# Altium project 5V_STEPDOWN.PrjPcb
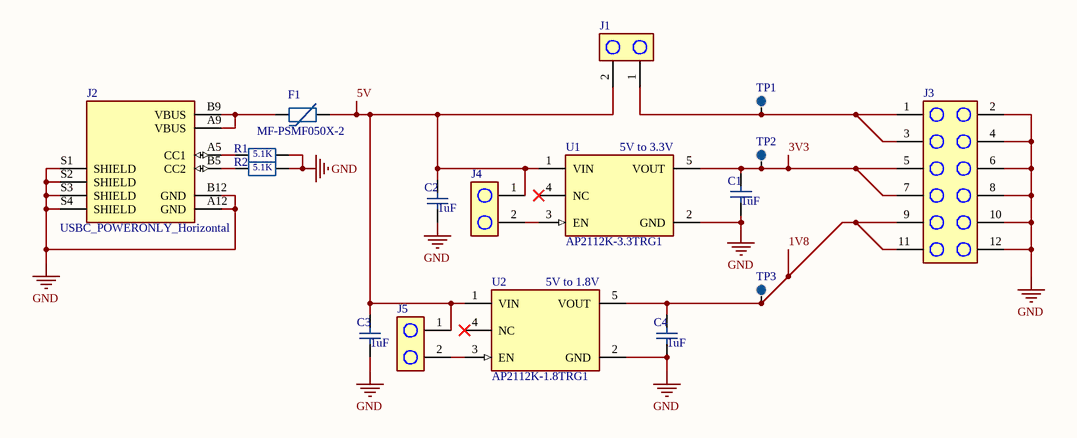
[diagram p0: Sheet1.SchDoc]
1 sheet, 17 parts. Net scope: global (net labels, ports and power ports of the same name join across sheets).
Board file: PCB1.PcbDoc

## Sheet Sheet1.SchDoc
size A2; SheetNumber: 1; SheetTotal: 1

### Parts
C1  1uF  [CAP_0603]
C2  1uF  [CAP_0603]
C3  1uF  [CAP_0603]
C4  1uF  [CAP_0603]
F1  MF-PSMF050X-2  [MF-PSMF050X]
J1  TSW-102-07-G-S  [TSW-102-07-G-S]  (value not drawn)
J2  USBC_POWERONLY_Horizontal  [USBC_POWERDELIVERY_HORIZONTAL]
J3  10129381-912002BLF  [10129381-912002BLF]  (value not drawn)
J4  TSW-102-07-G-S  [TSW-102-07-G-S]  (value not drawn)
J5  TSW-102-07-G-S  [TSW-102-07-G-S]  (value not drawn)
R1  5.1K  [RES_0603]
R2  5.1K  [RES_0603]
TP1  TestPoint_0.4mm  [TestPoint_0.4mm_SMD]  (value not drawn)  (no BOM)
TP2  TestPoint_0.4mm  [TestPoint_0.4mm_SMD]  (value not drawn)  (no BOM)
TP3  TestPoint_0.4mm  [TestPoint_0.4mm_SMD]  (value not drawn)  (no BOM)
U1  AP2112K-3.3TRG1  [AP2112K-3.3TRG1]
U2  AP2112K-1.8TRG1  [AP2112K-1.8TRG1]

### Nets
GND: C1.1 C2.1 C3.1 C4.1 J2.A12(GND) J2.B12(GND) J2.S1(SHIELD) J2.S2(SHIELD) J2.S3(SHIELD) J2.S4(SHIELD) J3.2 J3.4 J3.6 J3.8 J3.10 J3.12 R1.2 R2.2 U1.2(GND) U2.2(GND)
1V8: C4.2 J3.9 J3.11 TP3.1 U2.5(VOUT)
3V3: C1.2 J3.5 J3.7 TP2.1 U1.5(VOUT)
5V: C2.2 C3.2 F1.2 J1.2 J4.1 J5.1 U1.1(VIN) U2.1(VIN)
NetF1_1: F1.1 J2.A9(VBUS) J2.B9(VBUS)
NetJ1_1: J1.1 J3.1 J3.3 TP1.1
NetJ2_A5: J2.A5(CC1) R1.1
NetJ2_B5: J2.B5(CC2) R2.1
NetJ4_2: J4.2 U1.3(EN)
NetJ5_2: J5.2 U2.3(EN)

Not connected (* = marked no-connect by the designer): U1 4(NC)*; U2 4(NC)*

### Notes on the sheet
- (near U1) 5V to 3.3V
- (near U2) 5V to 1.8V

### Library data of the parts
C1-C4 = C_1u_0603: 1 uF 10% 0603 X7R MLCC; Manufacturer: Yageo; Manufacturer Part Number: CC0603KRX7R7BB105; Package (Imperial): 0603; Voltage Rating DC: 16 VDC; Value: 1 uF; Tolerance: 10%; Dielectric: X7R; Datasheet: https://yageogroup.com/component-documentation/download/datasheet/CC0603KRX7R7BB105?lang=en; Supplier 1: Mouser; Supplier Part Number 1: 603-CC603KRX7R7BB105; Supplier 2: DigiKey; Supplier Part Number 2: 311-1446-1-ND
F1 = MF-PSMF050X-2: PPTC 1V 0.5A; Manufacturer: Bourns; Package (Imperial): 0805; Hold Current: 500 mA; Trip Current: 1 A; Maximum Current: 40 A; Maximum Voltage: 6 VDC; Manufacturer Part Number: MF-PSMF050X-2; Termination: Recessed SMD; Supplier 1: Mouser; Supplier Part Number 1: 652-MF-PSMF050X-2; Supplier 2: DigiKey; Supplier Part Number 2: MF-PSMF050X-2CT-ND
J1 J4 J5 = TSW-102-07-G-S: 1x2 Headers 2.54 Pitch; Manufacturer: Samtec; Number of Positions: 2; Pitch: 2.54 mm; Manufacturer Part Number: TSW-102-07-G-S; Number of Rows: 1; Supplier 1: Mouser; Supplier Part Number 1: 200-TSW10207GS; Supplier 2: DigiKey; Supplier Part Number 2: 612-TSW-102-07-G-S-ND; ComponentLink1Description: Datasheet; ComponentLink1URL: https://www.mouser.in/datasheet/3/85/1/htsw_th.pdf
J2 = USBC_POWERONLY_Horizontal: USB-C, 6 Contact Power Delivery Port; Manufacturer: GCT; Manufacturer Part Number: USB4125-GF-A-0190; Number of Contacts: 6; Current Rating: 3 A; Voltage Rating: 48 VDC; Standard: USB-PD; Termination: SMD; Supplier 1: Mouser; Supplier Part Number 1: 640-USB4125-GF-A-190; Supplier 2: DigiKey; Supplier Part Number 2: 2073-USB4125-GF-A-0190DKR-ND
J3 = 10129381-912002BLF: 2x6 Headers 2.54 Pitch; Manufacturer: Amphenol FCI; Number of Positions: 12; Pitch: 2.54 mm; Mounting Angle: Straight; Plating: Gold; Manufacturer Part Number: 10129381-912002BLF; Number of Rows: 2; Mounting Style: SMD; Supplier 1: Mouser; Supplier Part Number 1: 649-1012938191202BLF; Supplier 2: DigiKey; Supplier Part Number 2: 10129381-912002BLF-ND
R1 R2 = R_5.1K_0603: 5.1 kOhm 1% 0603 resistor; Manufacturer: Yageo; Manufacturer Part Number: RC0603FR-075K1L; Package (Imperial): 0603; Power Rating: 0.1 W; Voltage Rating: 75 V; Value: 5.1 kOhm; Tolerance: 1%; ComponentLink1Description: Datasheet; ComponentLink1URL: https://yageogroup.com/content/datasheet/asset/file/PYU-RC_GROUP_51_ROHS_L; Supplier 1: Mouser; Supplier Part Number 1: 603-RC0603FR-075K1L; Supplier 2: DigiKey; Supplier Part Number 2: 311-5.10KHRCT-ND
TP1-TP3 = TestPoint_0.4mm: SMD Testpoint. No component to be bought.
U1 = AP2112K-3.3TRG1: 600 mA 3.3 V LDO; Manufacturer: Diodes Incorporated; Input Voltage: 5 V; Output Voltage: 3.3 V; Output Current: 600 mA; Manufacturer Part Number: AP2112K-3.3TRG1; Package: SOT-25-5; Topology: LDO; Supplier 1: Mouser; Supplier Part Number 1: 621-AP2112K-3.3TRG1; Supplier 2: DigiKey; Supplier Part Number 2: AP2112K-3.3TRG1DICT-ND
U2 = AP2112K-1.8TRG1: 600 mA 1.8 V LDO; Manufacturer: Diodes Incorporated; Input Voltage: 5 V; Output Voltage: 1.8 V; Output Current: 600 mA; Manufacturer Part Number: AP2112K-1.8TRG1; Package: SOT-23-5; Topology: LDO; Supplier 1: Mouser; Supplier Part Number 1: 621-AP2112K-1.8TRG1; Supplier 2: DigiKey; Supplier Part Number 2: AP2112K-1.8TRG1DICT-ND